# Altium schematic sheet top.SchDoc: Top
size A4; CompanyName: AGH University of Krakow; Engineer: Jakub Kwiecień; Revision: 2; SheetNumber: 1; SheetTotal: 4
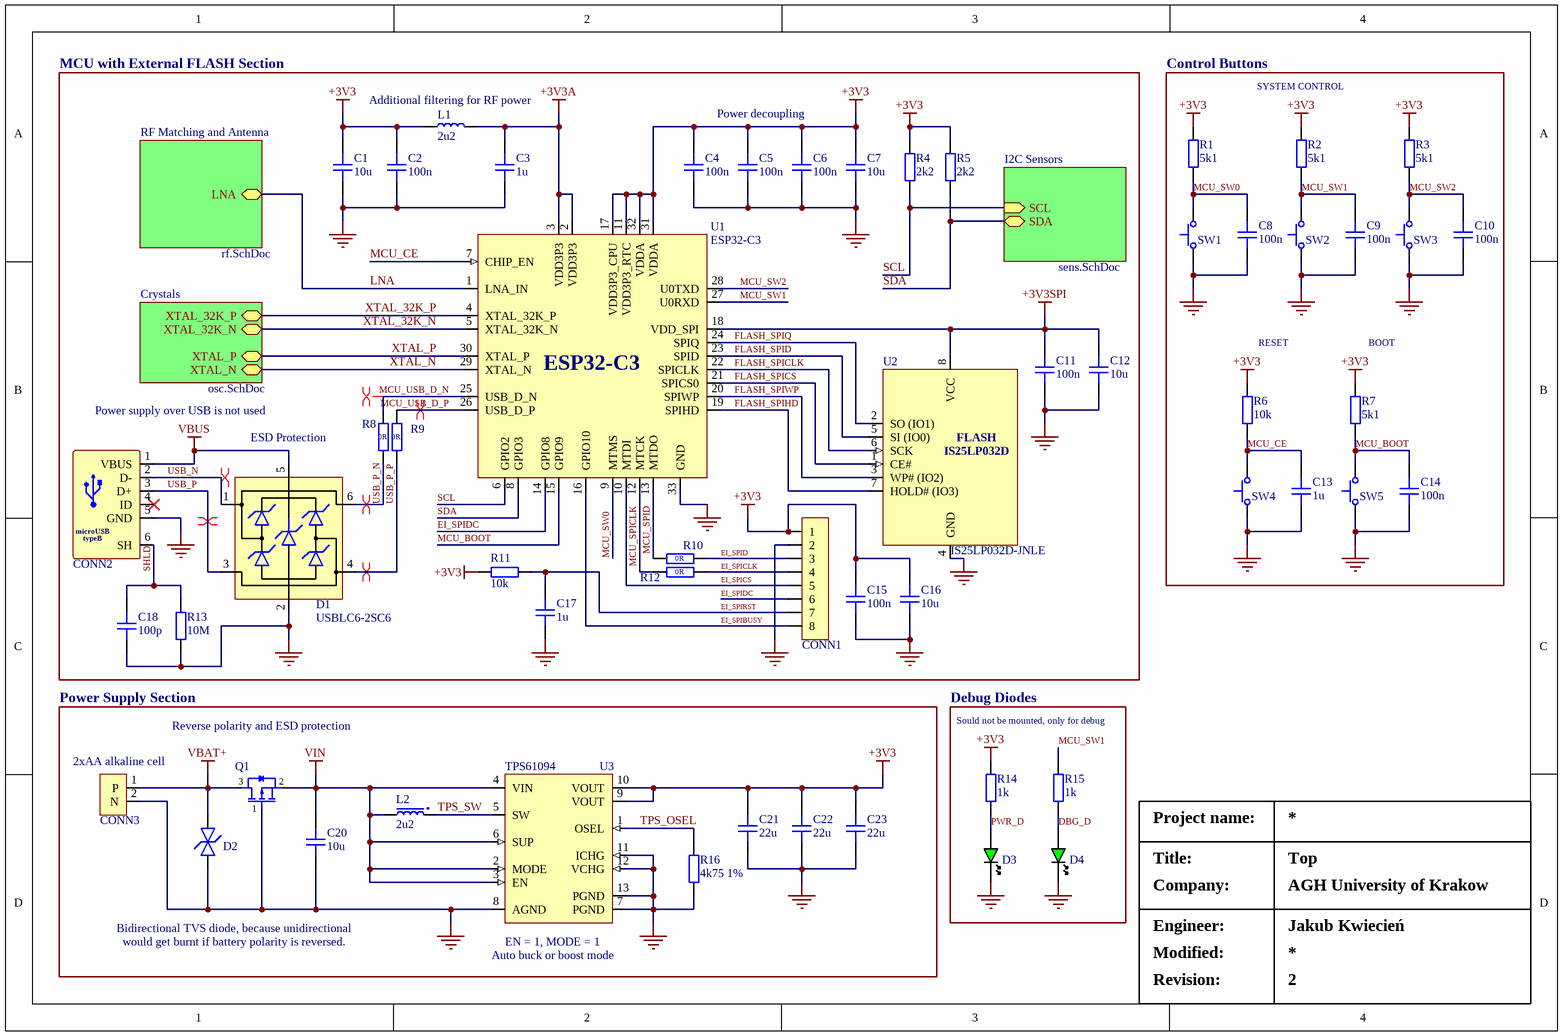
[diagram p0: top.SchDoc]

## Parts
C1  10u  [CAP_0603]
C2  100n  [CAP_0603]
C3  1u  [CAP_0603]
C4  100n  [CAP_0603]
C5  100n  [CAP_0603]
C6  100n  [CAP_0603]
C7  10u  [CAP_0603]
C8  100n  [CAP_0603]
C9  100n  [CAP_0603]
C10  100n  [CAP_0603]
C11  100n  [CAP_0603]
C12  10u  [CAP_0603]
C13  1u  [CAP_0603]
C14  100n  [CAP_0603]
C15  100n  [CAP_0603]
C16  10u  [CAP_0603]
C17  1u  [CAP_0603]
C18  100p  [CAP_0603]
C20  10u  [CAP_0603]
C21  22u  [CAP_0805]
C22  22u  [CAP_0805]
C23  22u  [CAP_0805]
CONN1  GOLDPIN_8x1  [GPx8_2.54mm_LONG_PADS_90deg]  (value not drawn)
CONN2  CONN_microUSB_B  [USB_B_105017-0001]  (value not drawn)
CONN3  2x2.5mm_JST_90deg_Female_Connector  [2x2.5mm_JST_Female_Connector_90deg _Long_Pads]  (value not drawn)
D1  USBLC6-2SC6  [SOT-23-6]
D2  TVS_UNI  [TVS_BI]  (value not drawn)
D3  LED_SMD_GREEN  [LED_0805_GREEN]  (value not drawn)
D4  LED_SMD_GREEN  [LED_0805_GREEN]  (value not drawn)
L1  2u2  [L_0603]
L2  2u2  [HPI0530-2R2]
Q1  SI2323DS-T1-E3  [SOT-23-3]  (value not drawn)
R1  5k1  [RES_0603]
R2  5k1  [RES_0603]
R3  5k1  [RES_0603]
R4  2k2  [RES_0603]
R5  2k2  [RES_0603]
R6  10k  [RES_0603]
R7  5k1  [RES_0603]
R8  0R  [RES_0603]
R9  0R  [RES_0603]
R10  0R  [RES_0603]
R11  10k  [RES_0603]
R12  0R  [RES_0603]
R13  10M  [RES_0603]
R14  1k  [RES_0603]
R15  1k  [RES_0603]
R16  4k75 1%  [RES_0603]
SW1  TACT_SWITCH_SMD_19mm  [TACT_SW_19mm]  (value not drawn)
SW2  TACT_SWITCH_SMD_19mm  [TACT_SW_19mm]  (value not drawn)
SW3  TACT_SWITCH_SMD_19mm  [TACT_SW_19mm]  (value not drawn)
SW4  TACT_SWITCH_19mm  [TACT_SW]  (value not drawn)
SW5  TACT_SWITCH_19mm  [TACT_SW]  (value not drawn)
U1  ESP32-C3  [ESP32-C3_QFN32_5x5-0.5]
U2  IS25LP032D-JNLE  [SOIC-8]
U3  TPS61094DSSR  [WSON-12]  (value not drawn)

## Blocks framed on the sheet
MCU with External FLASH Section: C1-C7 C11 C12 C15-C18 CONN1 CONN2 D1 L1 R4 R5 R8-R13 U1 U2
Control Buttons: C8-C10 C13 C14 R1-R3 R6 R7 SW1-SW5
Power Supply Section: C20-C23 CONN3 D2 L2 Q1 R16 U3
Debug Diodes: D3 D4 R14 R15

## Sub-sheets
Crystals = osc.SchDoc: XTAL_32K_P (bidir), XTAL_32K_N (bidir), XTAL_P (bidir), XTAL_N (bidir)
I2C Sensors = sens.SchDoc: SDA (bidir), SCL (in)
RF Matching and Antenna = rf.SchDoc: LNA (bidir)

## Nets
+3V3: C1.2 C2.2 C4.2 C5.2 C6.2 C7.2 C15.2 C16.2 C21.2 C22.2 C23.2 CONN1.1 L1.1 R1.2 R2.2 R3.2 R4.1 R5.1 R6.2 R7.2 R11.2 R14.2 U1.11(VDD3P3_RTC) U1.17(VDD3P3_CPU) U1.31(VDDA) U1.32(VDDA) U3.9(VOUT) U3.10(VOUT)
+3V3A: C3.2 L1.2 U1.2(VDD3P3) U1.3(VDD3P3)
+3V3SPI: C11.2 C12.2 U1.18(VDD_SPI) U2.8(VCC)
GND: C1.1 C2.1 C3.1 C4.1 C5.1 C6.1 C7.1 C8.1 C9.1 C10.1 C11.1 C12.1 C13.1 C14.1 C15.1 C16.1 C17.1 C18.2 C20.1 C21.1 C22.1 C23.1 CONN1.2 CONN2.5(GND) CONN3.2(N) D1.2(GND) D2.2 D3.K D4.K Q1.1 R13.2 R16.1 SW1.1 SW2.1 SW3.1 SW4.1 SW5.1 U1.33(GND) U2.4(GND) U3.7(PGND) U3.8(AGND) U3.11(ICHG) U3.12(VCHG) U3.13(PGND)
VBAT+: CONN3.1(P) D2.1 Q1.3
VBUS: CONN2.1(VBUS) D1.5(VBUS)
VIN: C20.2 L2.2 Q1.2 U3.2(MODE) U3.3(EN) U3.4(VIN) U3.6(SUP)
DBG_D: D4.A R15.1
EI_SPIBUSY: CONN1.8 U1.16(GPIO10)
EI_SPICLK: CONN1.4 R12.1
EI_SPICS: CONN1.5 U1.10(MTDI)
EI_SPID: CONN1.3 R10.1
EI_SPIDC: CONN1.6 U1.14(GPIO8)
EI_SPIRST: C17.2 CONN1.7 R11.1
FLASH_SPICLK: U1.22(SPICLK) U2.6(SCK)
FLASH_SPICS: U1.21(SPICS0) U2.1(CE#)
FLASH_SPID: U1.23(SPID) U2.5(SI_(IO0))
FLASH_SPIHD: U1.19(SPIHD) U2.7(HOLD#_(IO3))
FLASH_SPIQ: U1.24(SPIQ) U2.2(SO_(IO1))
FLASH_SPIWP: U1.20(SPIWP) U2.3(WP#_(IO2))
LNA: U1.1(LNA_IN) ; sheet RF Matching and Antenna/LNA
MCU_BOOT: C14.2 R7.1 SW5.2 U1.15(GPIO9)
MCU_CE: C13.2 R6.1 SW4.2 U1.7(CHIP_EN)
MCU_SPICLK: R12.2 U1.12(MTCK)
MCU_SPID: R10.2 U1.13(MTDO)
MCU_SW0: C8.2 R1.1 SW1.2 U1.9(MTMS)
MCU_SW1: C9.2 R2.1 R15.2 SW2.2 U1.27(U0RXD)
MCU_SW2: C10.2 R3.1 SW3.2 U1.28(U0TXD)
MCU_USB_D_N: R8.1 U1.25(USB_D_N)
MCU_USB_D_P: R9.1 U1.26(USB_D_P)
PWR_D: D3.A R14.1
SCL: R4.2 U1.6(GPIO2) ; sheet I2C Sensors/SCL
SDA: R5.2 U1.8(GPIO3) ; sheet I2C Sensors/SDA
SHLD: C18.1 CONN2.6(SH) R13.1
TPS_OSEL: R16.2 U3.1(OSEL)
TPS_SW: L2.1 U3.5(SW)
USB_N: CONN2.2(D-) D1.1(IO1)
USB_P: CONN2.3(D+) D1.3(IO2)
USB_P_N: D1.6(IO1) R8.2
USB_P_P: D1.4(IO2) R9.2
XTAL_32K_N: U1.5(XTAL_32K_N) ; sheet Crystals/XTAL_32K_N
XTAL_32K_P: U1.4(XTAL_32K_P) ; sheet Crystals/XTAL_32K_P
XTAL_N: U1.29(XTAL_N) ; sheet Crystals/XTAL_N
XTAL_P: U1.30(XTAL_P) ; sheet Crystals/XTAL_P

Not connected (* = marked no-connect by the designer): CONN2 4(ID)*

## Layout directives
differential pair; differential pair class DIFF_USB: MCU_USB_D_N, MCU_USB_D_P, USB_N, USB_P, USB_P_N, USB_P_P

## Notes on the sheet
- (near L1) Additional filtering for RF power
- Power decoupling
- (near R2) SYSTEM CONTROL
- (near R6) RESET
- (near R7) BOOT
- Power supply over USB is not used
- ESD Protection
- Sould not be mounted, only for debug
- (near CONN3) 2xAA alkaline cell
- Reverse polarity and ESD protection
- Bidirectional TVS diode, because unidirectional
- would get burnt if battery polarity is reversed.
- (near U3) Auto buck or boost mode
- (near U3) EN = 1, MODE = 1
- Project name:
- Title:
- Company:
- Engineer:
- Modified:
- Revision:
- (in symbol CONN_microUSB_B) microUSB; typeB
- (in symbol IS25LP032D-JNLE) FLASH; IS25LP032D

## Library data of the parts
C1 C2 C4-C12 C14-C16 C20 = CAP_0603: Capacitor SMD 0603; Manufacturer: SAMSUNG; Manufacturer Part Number: *; ComponentLink1Description: Distributor Link
  C1 C7 C12 C16 C20: ComponentLink1URL: https://www.tme.eu/pl/details/cl10a106mo8nqnc/kondensatory-mlcc-smd/samsung/
  C2 C4-C6 C8-C11 C14 C15: ComponentLink1URL: https://www.tme.eu/pl/details/cl10b104kb8nnnc/kondensatory-mlcc-smd/samsung/
C3 C13 C17 = CAP_0603: Capacitor SMD 0603; Manufacturer: SAMSUNG; Manufacturer Part Number: CL10B105KO8NNND; ComponentLink1Description: Distributor Link; ComponentLink1URL: https://www.tme.eu/pl/details/cl10b105ko8nnnd/kondensatory-mlcc-smd/samsung/
C18 = CAP_0603: Capacitor SMD 0603; Manufacturer: Samsung; Manufacturer Part Number: CL10C101JB8NNND; ComponentLink1Description: Distributor Link; ComponentLink1URL: https://www.tme.eu/pl/details/cl10c101jb8nnnd/kondensatory-mlcc-smd/samsung/
C21-C23 = CAP_0805: Ceramic capacitor SMD 0805 X7R; Manufacturer: Samsung; Manufacturer Part Number: *; ComponentLink1Description: Distributor Link; ComponentLink1URL: https://www.tme.eu/pl/details/cl21a226maynnne/kondensatory-mlcc-smd/samsung/
CONN1 = GOLDPIN_8x1: Goldpin connector 2.54 mm; 8x1; Manufacturer: *; Manufacturer Part Number: *; ComponentLink1Description: Distributor Link; ComponentLink1URL: *; ComponentLink2Description: E-Ink Distributor Link; ComponentLink2URL: https://botland.com.pl/wyswietlacze-e-paper/9098-e-paper-e-ink-154-v21-200x200px-modul-z-wyswietlaczem-spi-waveshare-12955-5904422312497.html; ComponentLink3Description: E-Ink Datasheet; ComponentLink3URL: https://www.waveshare.com/w/upload/7/77/1.54inch_e-Paper_Datasheet.pdf; ComponentLink4Description: E-Ink Display Distributor Link; ComponentLink4URL: https://botland.com.pl/wyswietlacze-e-paper/9098-e-paper-e-ink-154-v21-200x200px-modul-z-wyswietlaczem-spi-waveshare-12955-5904422312497.html
CONN2 = CONN_microUSB_B: Manufacturer: Molex; Manufacturer Part Number: 105017-0001; ComponentLink1Description: Distributor Link; ComponentLink1URL: https://www.tme.eu/pl/details/mx-105017-0001/zlacza-usb-i-ieee1394/molex/105017-0001/; ComponentLink2Description: Datasheet; ComponentLink2URL: https://www.tme.eu/Document/b7989e722b05f5084c507fb3ad8f02cb/MX-105017-0001.pdf
CONN3 = 2x2.5mm_JST_Female_Connector: 2x2.5mm JST 90 Degree Angle Female Connector; Manufacturer Part Number: S2B-XH-A-1 (LF)(SN); Manufacturer: JST; ComponentLink1Description: Distibutor Link; ComponentLink2Description: Datasheet; ComponentLink2URL: https://www.tme.eu/Document/0a99312bb6c67d3f0f7869fe9a023cea/XH.pdf; ComponentLink3Description: Distributor Link; ComponentLink3URL: https://www.tme.eu/pl/details/s2b-xh-a-1/zlacza-sygnalowe-raster-2-50mm/jst/s2b-xh-a-1-lf-sn/
D1 = USBLC6-2SC6: Low-Capacitance ESD Protection USB; Manufacturer: STMicroelectronics; Manufacturer Part Number: USBLC6-2SC6; ComponentLink1Description: Distributor Link; ComponentLink1URL: https://www.tme.eu/pl/details/usblc6-2sc6/diody-zabezpieczajace-drabinki/stmicroelectronics/
D2 = TVS_BI: Unidirectional TVS diode in SOD323 package; Manufacturer: Diodes Incorporated; Manufacturer Part Number: SD03C-7; ComponentLink1Description: Distributor Link; ComponentLink1URL: https://www.tme.eu/pl/details/sd03c-7/diody-tvs-smd-dwukierunkowe/diodes-incorporated/; ComponentLink2Description: Datasheet; ComponentLink2URL: https://www.mouser.pl/datasheet/2/115/DIOD_S_A0009691204_1-2543345.pdf
D3 = LED_SMD_0805_GREEN: Green LED SMD 0805; Manufacturer: Broadcom; Manufacturer Part Number: HSMG-C170; ComponentLink1Description: Distributor Link; ComponentLink1URL: https://www.tme.eu/pl/details/hsmg-c170/diody-led-smd-kolorowe/broadcom-avago/; ComponentLink2Description: Datasheet; ComponentLink2URL: https://www.tme.eu/Document/63ab7d315fd8a426f46a244dda8ce81a/HSMG-C170.pdf
D4 = LED_SMD_0805_GREEN: Green LED SMD 0805; Manufacturer: *; Manufacturer Part Number: *; ComponentLink1Description: Distributor Link; ComponentLink1URL: *; ComponentLink2Description: Datasheet; ComponentLink2URL: *
L1 = L_603: Inductor SMD 0603; Manufacturer: Murata; Manufacturer Part Number: LQG18HN2N2S00D; ComponentLink1Description: Distributor Link; ComponentLink1URL: https://www.tme.eu/pl/details/lqg18hn2n2s00d/dlawiki/murata/
L2 = HPI0530-2R2: 2.2uH, 24mOhm DC Series Resistance, 20% Inductance Tolerance SMD Coil; Manufacturer: FERROCORE; Manufacturer Part Number: HPI0530-2R2; ComponentLink1Description: Distributor Link; ComponentLink1URL: https://www.tme.eu/pl/details/hpi0530-2r2/dlawiki/ferrocore/; ComponentLink2Description: Datasheet; ComponentLink2URL: https://www.tme.eu/Document/e149c9d15a89ae101acf458935804ce7/HPI0530.pdf
Q1 = SI2323DS-T1-E3: P-channel MOSFET in SOT23 package; Manufacturer: Vishay; ComponentLink1Description: Distributor Link; ComponentLink1URL: https://www.tme.eu/pl/details/si2323ds-t1-e3/tranzystory-z-kanalem-p-smd/vishay/; ComponentLink2Description: Datasheet; ComponentLink2URL: https://www.tme.eu/Document/d8e01dd5bf2cb7c72a3df62d79c95bb8/SI2323DS-T1-E3.pdf; Manufacturer Part Number: SI2323DS-T1-E3
R1-R3 R7 = RES_0603: Resistor SMD 0603; Manufacturer: YAEGO; Manufacturer Part Number: AC0603FR-075K1L; ComponentLink1Description: Distributor Link; ComponentLink1URL: https://www.tme.eu/pl/details/ac0603fr-075k1l/rezystory-smd/yageo/
R4 R5 = RES_0603: Resistor SMD 0603; Manufacturer: YAEGO; Manufacturer Part Number: AC0603FR-072K2L; ComponentLink1Description: Distributor Link
  R4: ComponentLink1URL: https://www.tme.eu/pl/details/ac0603fr-072k2l/rezystory-smd/yageo/
  R5: ComponentLink1URL: https://www.tme.eu/pl/details/rc0603fr-0710k/rezystory-smd/yageo/rc0603fr-0710kl/
R6 R11 = RES_0603: Resistor SMD 0603; Manufacturer: YAEGO; Manufacturer Part Number: RC0603FR-0710KL; ComponentLink1Description: Distributor Link; ComponentLink1URL: https://www.tme.eu/pl/details/rc0603fr-0710k/rezystory-smd/yageo/rc0603fr-0710kl/
R8-R10 R12 = RES_0603: Resistor SMD 0603; Manufacturer: YAEGO; Manufacturer Part Number: AC0603JR-070RL; ComponentLink1Description: Distributor Link; ComponentLink1URL: https://www.tme.eu/pl/details/ac0603jr-070rl/rezystory-smd/yageo/
R13 = RES_0603: Resistor SMD 0603; Manufacturer: YAGEO; Manufacturer Part Number: RC0603FR-0710ML; ComponentLink1Description: Distributor Link; ComponentLink1URL: https://www.tme.eu/pl/details/rc0603fr-0710ml/rezystory-smd/yageo/
R14 R15 = RES_0603: Resistor SMD 0603; Manufacturer: YAEGO; Manufacturer Part Number: RC0603FR-071KL; ComponentLink1Description: Distributor Link; ComponentLink1URL: https://www.tme.eu/pl/details/rc0603fr-071k/rezystory-smd/yageo/rc0603fr-071kl/
R16 = RES_0603: Resistor SMD 0603; Manufacturer: YAEGO; Manufacturer Part Number: *; ComponentLink1Description: Distributor Link; ComponentLink1URL: https://www.tme.eu/pl/details/rt0603fre074k75l/rezystory-smd/yageo/
SW1-SW3 = TACT_SWITCH_SMD_19mm: 19mm high SMD tact switch, SPST-NO; Manufacturer: Ninigi; Manufacturer Part Number: TACTM-619N-F; ComponentLink1Description: Distributor Link; ComponentLink1URL: *
SW4 SW5 = TACT_SWITCH_SMD: SMD tact switch, SPST-NO; Manufacturer: JIANFU; Manufacturer Part Number: TVCM04N016BB; ComponentLink1Description: Distributor Link; ComponentLink1URL: https://www.tme.eu/pl/details/tvcm04n016bb/mikroprzelaczniki-tact/jianfu/
U1 = ESP32-C3: ESP32-C3 SoC; Manufacturer: Espressif; Manufacturer Part Number: ESP32-C3; ComponentLink1Description: Distributor Link; ComponentLink1URL: https://www.tme.eu/pl/details/esp32c3/moduly-iot-wifi-bluetooth/espressif/esp32-c3/; ComponentLink2Description: Datasheet; ComponentLink2URL: https://www.espressif.com/sites/default/files/documentation/esp32-c3_datasheet_en.pdf
U2 = IS25LP032D-JNLE: 32Mb Flash Memory, 133MHz; 3.3V; 8-pin SOIC 150mil package; Manufacturer: ISSI; Manufacturer Part Number: IS25LP032D-JNLE; ComponentLink1Description: Distributor Link; ComponentLink1URL: https://www.tme.eu/pl/details/is25lp032d-jnle/pamieci-flash-szeregowe/issi/; ComponentLink2Description: Datasheet; ComponentLink2URL: https://www.tme.eu/Document/dd700c5f536aa953521ad00f369a0bda/IS25LP032D-JBLA3.pdf
U3 = TPS61094DSSR: Ultra-low quienscent current buck-boost converter with supercap or backup battery menagement; Manufacturer: Texas Instruments; Manufacturer Part Number: TPS61094; ComponentLink1Description: Distributor Link; ComponentLink1URL: https://www.tme.eu/pl/details/tps61094dssr/regulatory-napiecia-uklady-dc-dc/texas-instruments/; ComponentLink2Description: Datasheet; ComponentLink2URL: https://www.ti.com/lit/ds/symlink/tps61094.pdf?ts=1728502352509